# Altium schematic sheet Sheet3.SchDoc
size A; SheetNumber: 3; SheetTotal: 3
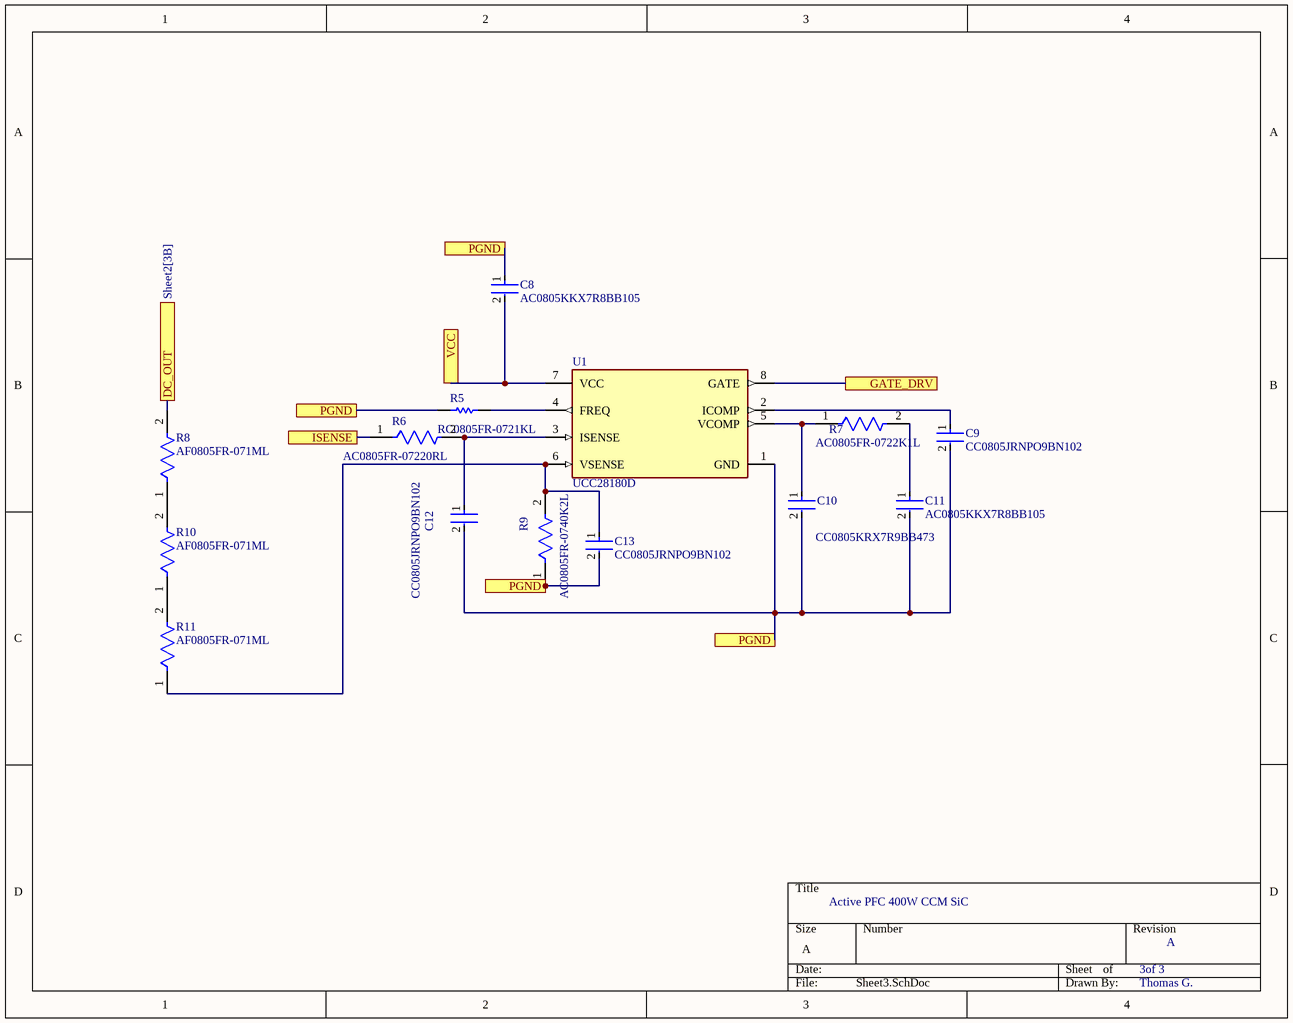
[diagram p0: Sheet3.SchDoc]

## Parts
C8  AC0805KKX7R8BB105  [FP-AC0805-0_85-MFG]
C9  CC0805JRNPO9BN102  [FP-CC0805-0_1-0_7-MFG]
C10  CC0805KRX7R9BB473  [FP-CC0805-0_85-MFG]
C11  AC0805KKX7R8BB105  [FP-AC0805-0_85-MFG]
C12  CC0805JRNPO9BN102  [FP-CC0805-0_1-0_7-MFG]
C13  CC0805JRNPO9BN102  [FP-CC0805-0_1-0_7-MFG]
R5  RC0805FR-0721KL  [RESC2013X60X35NL10T20]
R6  AC0805FR-07220RL  [FP-AC0805-MFG]
R7  AC0805FR-0722K1L  [FP-AC0805-MFG]
R8  AF0805FR-071ML  [FP-AF0805-MFG]
R9  AC0805FR-0740K2L  [FP-AC0805-MFG]
R10  AF0805FR-071ML  [FP-AF0805-MFG]
R11  AF0805FR-071ML  [FP-AF0805-MFG]
U1  UCC28180D  [FP-D0008A-MFG]

## Ports
DC_OUT (see Sheet2[3B]), GATE_DRV, ISENSE, PGND, VCC

## Nets
DC_OUT: R8.2 ; port DC_OUT
GATE_DRV: U1.8(GATE) ; port GATE_DRV
ISENSE: R6.1 ; port ISENSE
PGND: C8.1 C9.2 C10.2 C11.2 C12.2 C13.2 R5.1 R9.1 U1.1(GND) ; port PGND
VCC: C8.2 U1.7(VCC) ; port VCC
NetC9_1: C9.1 U1.2(ICOMP)
NetC10_1: C10.1 R7.1 U1.5(VCOMP)
NetC11_1: C11.1 R7.2
NetC12_1: C12.1 R6.2 U1.3(ISENSE)
NetC13_1: C13.1 R9.2 R11.1 U1.6(VSENSE)
NetR5_2: R5.2 U1.4(FREQ)
NetR8_1: R8.1 R10.2
NetR10_1: R10.1 R11.2

## Notes on the sheet
- Active PFC 400W CCM SiC
- 3of 3
- A
- Thomas G.

## Library data of the parts
C8 C11 = CMP-03422-000021-1: CAP CER 1UF 25V X7R 0805; Manufacturer: Yageo; Material: Ceramic; Temperature Coefficient: 15%; Tolerance: 0.1; Automotive Grade: Grade 1; Device Class L2: Capacitors; Height: 0.95mm; Manufacturer Part Number: AC0805KKX7R8BB105; Voltage Rating: 25 V; Capacitance: 1 uF; Automotive: Yes; Temperature Range Low: -55°C; ComponentLink2Description: Datasheet; RoHS: TRUE; ComponentLink2URL: http://www.yageo.com/documents/recent/UPY-AC_NP0X7R_16V-to-630V_12.pdf; Device Class L3: Ceramic Capacitors; Temperature Characteristic: X7R; Package: AC0805-0.85; Mouser Description: AC Series 0805 25 V 1 uF ±10% X7R Multilayer Ceramic Capacitor; Temperature: -55°C to +125°C; Octopart: https://octopart.com/ac0805kkx7r8bb105-yageo-75656631; Device Class L1: Passive Components; Category: Cap; Footprint Url: http://www.yageo.com/exep/pages/download/literatures/UPY-C_GEN_24.pdf; Ipc Land Pattern Name: CAPC200125X85; Temperature Range High: +125°C; Lead Free: Yes; Digikey Description: CAP CER 1UF 25V X7R 0805; Value: 1 uF
C9 C12 C13 = CMP-03422-001491-1: CAP CER 1000PF 50V C0G/NPO 0805; Dielectric Material: Ceramic; Dielectric: C0G; Temperature Coefficient: 30ppm/°C; Insulation Resistance: 10GR; Dissipation Factor: 0.1%; Capacitance: 1nF; Tolerance: 5%; Height: 0.6mm; Case/Package: 0805; Lead Free: Lead Free; Case Code (Metric): 2012; Length: 2mm; Max Operating Temperature: 125°C; Depth: 1.25mm; Thickness: 0.024inch; Width: 0.049inch; Series: CC; Voltage Rating: 50V; Package Quantity: 4000; Min Operating Temperature: -55°C; Termination: SMD/SMT; Radiation Hardening: No; Mount: Surface Mount; Packaging: Tape and Reel; Voltage Rating (DC): 50V; Case Code (Imperial): 0805; Resistor Type: Ceramic; RoHS Compliant: Yes; Voltage: 50V; REACH SVHC: No SVHC
C10 = CMP-03422-000052-1: CAP CER 0.047UF 50V X7R 0805; Manufacturer: Yageo; Value: 47 nF; Tolerance: 0.1; Material: Ceramic; Footprint Url: http://www.yageo.com/exep/pages/download/literatures/UPY-C_GEN_24.pdf; ComponentLink2URL: http://www.yageo.com/documents/recent/UPY-GPHC_Y5V_6.3V-to-50V_8.pdf; Ipc Land Pattern Name: CAPC200125X85; Manufacturer Part Number: CC0805KRX7R9BB473; Digikey Description: CAP CER 0.047UF 50V X7R 0805; Lead Free: Yes; Octopart: https://octopart.com/cc0805krx7r9bb473-yageo-42181304; Voltage Rating: 50 V; RoHS: TRUE; ComponentLink2Description: Datasheet; Temperature Range High: +85°C; Package: CC0805-0.85; Temperature Range Low: -30°C; Device Class L2: Capacitors; Device Class L3: Ceramic Capacitors; Height: 0.95mm; Temperature: -30°C to +85°C; Category: Cap; Device Class L1: Passive Components; Capacitance: 47 nF; Temperature Characteristic: X7R; Automotive: No; Mouser Description: Multilayer Ceramic Capacitors MLCC - SMD/SMT 47nF 50V X7R 10%
R5 = CMP-2001-01013-1: Manufacturer: Yageo; Part Number: RC0805FR-0721KL
R6 = CMP-2001-04488-2: RES SMD 220 OHM 1% 1/8W 0805; Manufacturer: Yageo; Value: 220Ω; Tolerance: 0.01; Voltage Rating: 150V; Automotive Grade: Grade 0; Automotive: Yes; Composition: Thick Film; Lead Free: Yes; Octopart: https://octopart.com/ac0805fr-07220rl-yageo-26041145; Series: AC; Device Class L1: Passive Components; Temperature: -55°C to +155°C; Device Class L3: Chip SMD Resistors; Package: AC0805; Digikey Description: RES SMD 220 OHM 1% 1/8W 0805; ComponentLink2URL: http://www.yageo.com/documents/recent/PYu-AC_51_RoHS_L_6.pdf; ComponentLink2Description: Datasheet; Resistance: 220Ω; Mouser Description: Thick Film Resistors - SMD 1/8W 220ohm 1% AEC-Q200; Ipc Land Pattern Name: RESC200125X50; Power Rating: 1/8W; Device Class L2: Resistors; Category: Res; Footprint Url: http://www.yageo.com/exep/pages/download/literatures/PYu-R_Mount_10.pdf; Manufacturer Part Number: AC0805FR-07220RL; Temperature Range Low: -55°C; Height: 0.6mm; Temperature Range High: +155°C; RoHS: TRUE
R7 = CMP-03412-037565-1: RES SMD 22.1K OHM 1% 1/8W 0805; Manufacturer: Yageo; Resistance: 22.1KΩ; Value: 22.1KΩ; Voltage Rating: 150V; Tolerance: 0.01; Automotive Grade: Grade 0; Ipc Land Pattern Name: RESC200125X50; Series: AC; RoHS: TRUE; Temperature Range Low: -55°C; Composition: Thick Film; Mouser Description: Res Thick Film 0805 22.1K Ohm 1% 1/8W ±100ppm/°C Molded SMD Paper T/R; Octopart: https://octopart.com/ac0805fr-0722k1l-yageo-71367622; Category: Res; ComponentLink2URL: http://www.yageo.com/documents/recent/PYu-AC_51_RoHS_L_6.pdf; Device Class L3: Chip SMD Resistors; Height: 0.6mm; ComponentLink2Description: Datasheet; Automotive: Yes; Lead Free: Yes; Power Rating: 1/8W; Device Class L2: Resistors; Manufacturer Part Number: AC0805FR-0722K1L; Package: AC0805; Digikey Description: RES SMD 22.1K OHM 1% 1/8W 0805; Footprint Url: http://www.yageo.com/exep/pages/download/literatures/PYu-R_Mount_10.pdf; Temperature: -55°C to +155°C; Device Class L1: Passive Components; Temperature Range High: +155°C
R8 R10 R11 = CMP-03412-037889-1: Anti-Sulfurated Chip Resistor Automotive Grade 1MΩ 1% 0.125W ±100ppm/°C 0805; Resistance: 1MR; Max Power Dissipation: 125mW; Height: 0.024inch; Packaging: Tape and Reel; Tolerance: 1%; Series: AF; Features: Moisture Resistant; Width: 0.049inch; Resistor Type: Thick Film; Number of Terminations: 2; RoHS Compliant: Yes; Max Operating Temperature: 155°C; Case/Package: 0805; Temperature Coefficient: 100ppm/°C; Min Operating Temperature: -55°C; Length: 0.079inch
R9 = CMP-03412-037646-1: RES SMD 40.2K OHM 1% 1/8W 0805; Manufacturer: Yageo; Resistance: 40.2KΩ; Tolerance: 0.01; Voltage Rating: 150V; Automotive Grade: Grade 0; Value: 40.2KΩ; Temperature Range Low: -55°C; Composition: Thick Film; Device Class L1: Passive Components; Temperature Range High: +155°C; Digikey Description: RES SMD 40.2K OHM 1% 1/8W 0805; Manufacturer Part Number: AC0805FR-0740K2L; Height: 0.6mm; Category: Res; ComponentLink2Description: Datasheet; Automotive: Yes; Ipc Land Pattern Name: RESC200125X50; Footprint Url: http://www.yageo.com/exep/pages/download/literatures/PYu-R_Mount_10.pdf; Temperature: -55°C to +155°C; RoHS: TRUE; Series: AC; Device Class L3: Chip SMD Resistors; Octopart: https://octopart.com/ac0805fr-0740k2l-yageo-30510925; Package: AC0805; Lead Free: Yes; Device Class L2: Resistors; Power Rating: 1/8W; ComponentLink2URL: http://www.yageo.com/documents/recent/PYu-AC_51_RoHS_L_6.pdf
U1 = CMP-04918-000038-1: IC PFC CTRLR AVERAGE CURR 8SOIC; Manufacturer: Texas Instruments; Max Supply Voltage: 21V; Output Type: Fixed; Max Duty Cycle: 98%; Number Of Outputs: 1; Output Voltage: 390mV; Standoff Height: 0.11mm; Output Current: 40uA; Nominal Supply Current: 7mA; Switching Frequency: 65kHz; Max Junction Temp: +125°C; Switching Topology: Buck; Lead Free: Yes; Height: 1.75mm; Automotive: No; Category: IC; Device Class L1: Integrated Circuits (ICs); Octopart: https://octopart.com/ucc28180d-texas+instruments-31566950; Mouser Description: Power Factor Correction - PFC 8-PIN CCM PFC CONTROLLER; Ipc Land Pattern Name: SOIC127P600X175-8; RoHS: TRUE; Temperature: -40°C to +125°C; Package: D0008A; Temperature Range High: +125°C; Device Class L3: Voltage Regulators - Switching; ComponentLink2Description: Datasheet; Device Class L2: Power Management ICs; Manufacturer Part Number: UCC28180D; Temperature Range Low: -40°C; Digikey Description: IC PFC CTRLR AVERAGE CURR 8SOIC; ComponentLink2URL: http://www.ti.com/lit/ds/symlink/ucc28180.pdf